# EasyEDA Pro project esp32-s3-handheld-jlcpcb-project.epro, board PCB1_1
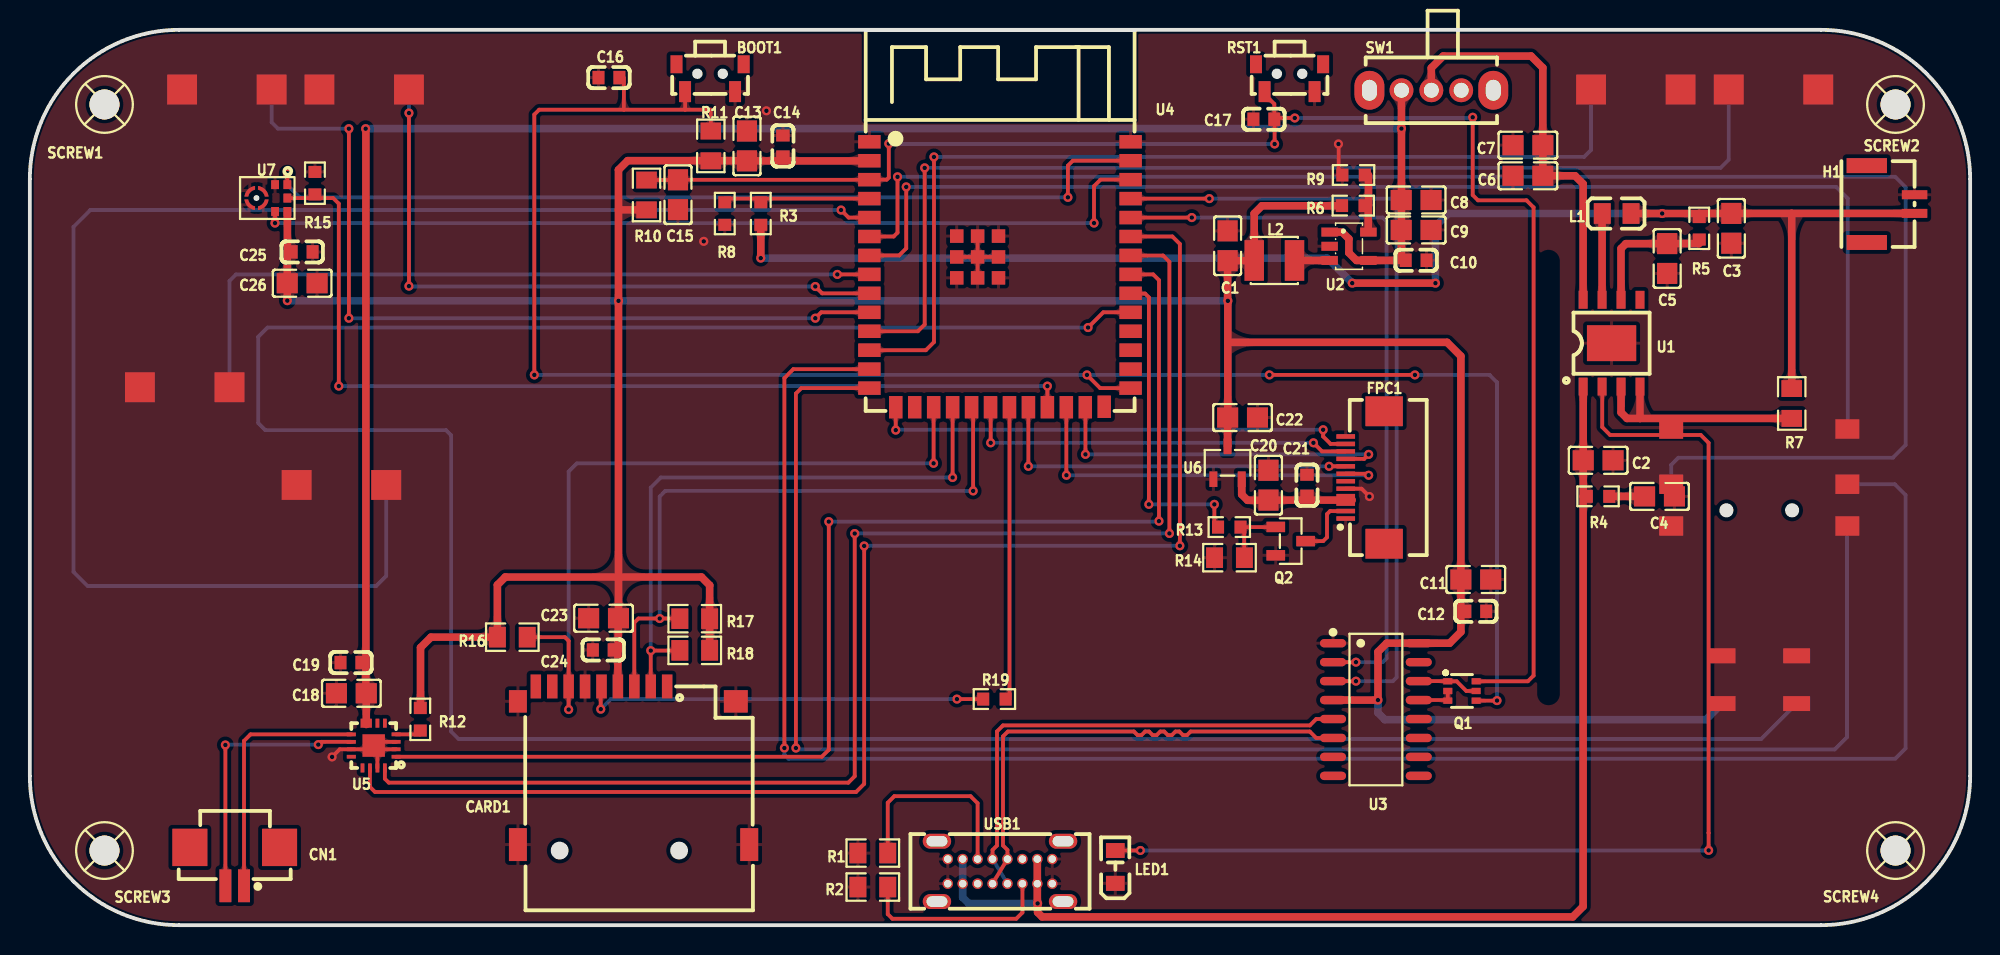
[diagram p1: board, top side]
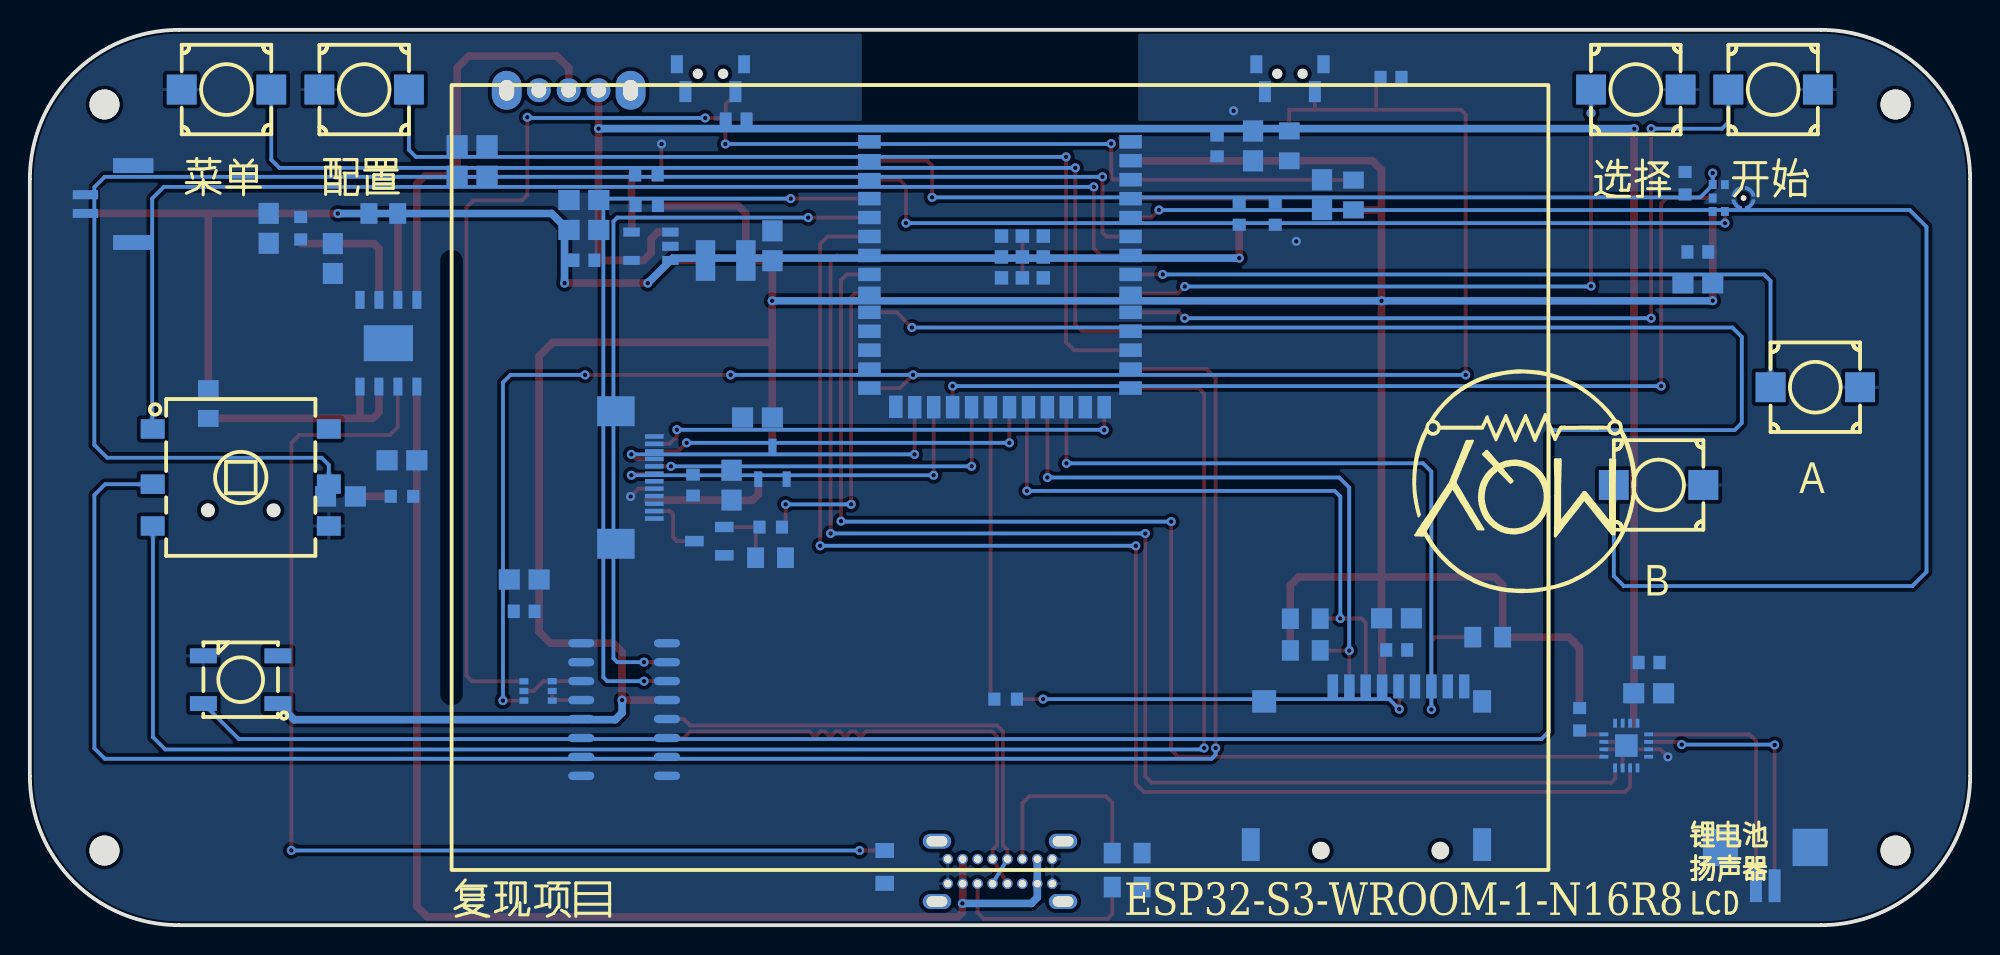
[diagram p2: board, bottom side, seen from below]

Outline 130 x 60 mm; copper layers: Top Layer, Bottom Layer. Coordinates in mm from the lower left corner of the outline.
Outline path: 0,50 0,10 arc(2.93,2.93) 10,0 120,0 arc(127.07,2.93) 130,10 130,50 arc(127.07,57.07) 120,60 10,60 arc(2.93,57.07) 0,50
Stack: Top Layer 0.035mm / Dielectric1 1.51mm FR4 er 4.5 / Bottom Layer 0.035mm

## Design rules (mm)
net D+: DP1
net D-: DP1
spacing copperThickness1oz (default): track to track 0.102, other pairs 0 to 0.3
spacing copperThickness2oz: track to track 0.203, other pairs 0.152 to 0.3
track width copperThickness1oz (default): min 0.127, default 0.254, max 2.54
track width copperThickness2oz: min 0.203, default 0.254, max 2.54
track width power: min 0.254, default 0.508, max 2.54
differential pair differentialPair (default): width min 0.127, default 0.254, max 2.54; gap min 0.152, default 0.152
net GND uses copperRegion

## Placement (name value [footprint] x y rotation side)
BOOT1  TS24CA 250gf 013  [SW-SMD_L4.7-W3.5-P3.35-EH]  45.58 56.77 0 top
C1  22uF  [C0805]  80.25 45.53 270 top
C2  10uF  [C0805]  105.07 31.15 180 top
C3  22uF  [C0805]  114 46.7 90 top
C4  10uF  [C0805]  109.19 28.73 180 top
C5  22uF  [C0805]  109.7 44.67 90 top
C6  22uF  [C0805]  100.37 50.22 0 top
C7  22uF  [C0805]  100.37 52.27 0 top
C8  22uF  [C0805]  92.88 48.6 180 top
C9  22uF  [C0805]  92.88 46.59 180 top
C10  100nF  [C0603]  92.88 44.56 180 top
C11  10uF  [C0805]  96.88 23.16 180 top
C12  100nF  [C0603]  96.88 21.03 180 top
C13  10uF  [C0805]  48.05 52.22 270 top
C14  100nF  [C0603]  50.46 52.22 270 top
C15  1uF  [C0805]  43.43 48.95 90 top
C16  100nF  [C0603]  38.8 56.8 180 top
C17  100nF  [C0603]  82.68 54.01 180 top
C18  10uF  [C0805]  21.54 15.54 180 top
C19  100nF  [C0603]  21.51 17.6 180 top
C20  10uF  [C0805]  82.98 29.49 270 top
C21  100nF  [C0603]  85.57 29.49 90 top
C22  10uF  [C0805]  81.25 34.02 0 top
C23  10uF  [C0805]  38.44 20.57 180 top
C24  100nF  [C0603]  38.42 18.44 180 top
C25  100nF  [C0603]  18.25 45.12 0 top
C26  10uF  [C0805]  18.25 43.02 180 top
CARD1  TF PUSH  [TF-SMD_TF-PUSH]  40.45 10.7 0 top
CN1  HC-1.25-2PWT  [CONN-SMD_2P-P1.25-HC-1.25-2PWT]  13.72 3.92 180 top
FPC1  FPC-05F-12PH20  [FPC-SMD_12P-P0.50_FPC-05F-12PH20]  89.45 30 90 top
H1  A1257WR-S-2P  [CONN-SMD_A1257WR-S-2P]  124.68 48.32 270 top
KEY1  HX TS665WS 200gf  [KEY-SMD_L6.0-W6.0-LS6.6]  116.82 56 0 bottom
KEY2  HX TS665WS 200gf  [KEY-SMD_L6.0-W6.0-LS6.6]  107.6 56 0 bottom
KEY3  HX TS665WS 200gf  [KEY-SMD_L6.0-W6.0-LS6.6]  22.4 56 180 bottom
KEY4  HX TS665WS 200gf  [KEY-SMD_L6.0-W6.0-LS6.6]  13.2 56 180 bottom
KEY5  HX TS665WS 200gf  [KEY-SMD_L6.0-W6.0-LS6.6]  10.38 36.05 180 bottom
KEY6  HX TS665WS 200gf  [KEY-SMD_L6.0-W6.0-LS6.6]  20.88 29.5 180 bottom
L1  1uH  [L0805]  106.32 47.69 0 top
L2  2.2uH  [IND-SMD_L3.0-W3.0_FNR30XXS]  83.38 44.55 0 top
LED1  XL-2012UOC  [LED0805-RD_ORANGE]  72.72 3.9 90 top
LED2  XL-5050RGBC-2812B-S  [LED-SMD_4P-L5.0-W5.0-TL-1]  115.88 16.45 0 bottom
Q1  UMH3N  [SC-70-6_L2.2-W1.3-P0.65-LS2.1-BR]  95.95 15.69 180 top
Q2  SS8050  [SOT-23-3_L2.9-W1.3-P1.90-LS2.4-BR]  84.48 25.74 180 top
R1  5.1kΩ  [R0805]  56.48 4.83 180 top
R2  5.1kΩ  [R0805]  56.48 2.55 0 top
R3  100kΩ  [R0603]  48.97 47.69 270 top
R4  2Ω  [R0603]  105.07 28.74 180 top
R5  500mΩ  [R0603]  111.85 46.7 90 top
R6  680kΩ  [R0603]  88.67 48.22 180 top
R7  1kΩ  [R0805]  118.05 34.96 90 top
R8  100kΩ  [R0603]  46.56 47.69 90 top
R9  150kΩ  [R0603]  88.69 50.27 0 top
R10  10kΩ  [R0805]  41.32 48.93 270 top
R11  10kΩ  [R0805]  45.62 52.22 90 top
R12  100kΩ  [R0603]  26.16 13.79 90 top
R13  2.2kΩ  [R0603]  80.36 26.68 0 top
R14  10kΩ  [R0805]  80.38 24.63 0 top
R15  100kΩ  [R0603]  19.1 49.72 90 top
R16  10kΩ  [R0805]  32.33 19.3 180 top
R17  10kΩ  [R0805]  44.55 20.54 0 top
R18  10kΩ  [R0805]  44.55 18.41 0 top
R19  22Ω  [R0603]  64.62 15.15 180 top
RST1  TS24CA 250gf 013  [SW-SMD_L4.7-W3.5-P3.35-EH]  84.4 56.77 0 top
SCREW1  -  [M2螺丝]  5 55 0 top
SCREW2  -  [M2螺丝]  125 55 0 top
SCREW3  -  [M2螺丝]  5 5 0 top
SCREW4  -  [M2螺丝]  125 5 0 top
SW1  SK12D07VG3  [SW-TH_SK12D07VG3]  93.9 55.95 180 top
SW2  10*10*9-6P WX  [SW-SMD-6P-L10.5-W10.0_C2858290]  115.87 30 180 bottom
U1  IP5306  [ESOP-8_L4.9-W3.9-P1.27-LS6.0-BL-EP]  105.97 39 0 top
U2  TLV62568DBVR  [SOT-23-5_L3.0-W1.7-P0.95-LS2.8-BR]  88.38 45.5 180 top
U3  CH340C  [SOP-16_L10.0-W3.9-P1.27-LS6.0-BL]  90.19 14.45 270 top
U4  ESP32-S3-WROOM-1-N16R8  [WIRELM-SMD_ESP32-S3-WROOM-1]  65 43.6 0 top
U5  MAX98357AETE+T  [TQFN-16_L3.0-W3.0-P0.50-BL-EP1.5]  23.04 12.03 90 top
U6  ME6210A33M3G  [SOT-23-3_L3.0-W1.7-P0.95-LS2.9-BR]  80.25 30.99 270 top
U7  ICS-43434  [MIC-SMD_6P-L3.5-W2.7-P0.90-BL]  15.97 48.73 180 top
USB1  HX-TYPE-C 16P 180 LC-B H13.0  [USB-C-TH_TYPE-C16PLCH10.0-B143]  65 3.6 0 top

## Footprints (pads in the part's own frame, mm; a bottom-side part is the same pattern mirrored in y, then rotated)
C0603
  rect 0.8x0.9 hole 0.001: 1(-0.7,0) 2(0.7,0)
C0805
  rect 1.41x1.35 hole 0.001: 1(-1,0) 2(1,0)
CONN-SMD_2P-P1.25-HC-1.25-2PWT
  rect 0.8x2.2 hole 0.001: 1(-0.625,1.285) 2(0.625,1.285)
  rect 2.35x2.5 hole 0.001: 3(-3.005,-1.285) 4(3.005,-1.285)
CONN-SMD_A1257WR-S-2P
  rect 0.6x1.7 hole 0.001: 1(0.625,1.6) 2(-0.625,1.6)
  rect 1x2.7 hole 0.001: 3(2.575,-1.6) 4(-2.575,-1.6)
ESOP-8_L4.9-W3.9-P1.27-LS6.0-BL-EP
  rect 0.6x1.2 hole 0.001: 1(-1.905,-2.909) 2(-0.635,-2.909) 3(0.635,-2.909) 4(1.905,-2.909) 5(1.905,2.909) 6(0.635,2.909) 7(-0.635,2.909) 8(-1.905,2.909)
  rect 3.3x2.4 hole 0.001: 9(0,0)
FPC-SMD_12P-P0.50_FPC-05F-12PH20
  rect 0.3x1.25 hole 0.001: 1(-2.75,1.288) 2(-2.25,1.288) 3(-1.75,1.288) 4(-1.25,1.288) 5(-0.75,1.288) 6(-0.25,1.288) 7(0.25,1.288) 8(0.75,1.288) 9(1.25,1.288) 10(1.75,1.288) 11(2.25,1.288) 12(2.75,1.288)
  rect 2x2.5 hole 0.001: 13(4.44,-1.288) 14(-4.44,-1.288)
IND-SMD_L3.0-W3.0_FNR30XXS
  rect 1.3x2.72 hole 0.001: 1(1.35,0) 2(-1.35,0)
KEY-SMD_L6.0-W6.0-LS6.6
  rect 2x2 hole 0.001: 1(-3,0) 2(3,0)
L0805
  rect 1.133x1.377 hole 0.001: 1(-0.966,0) 2(0.966,0)
LED0805-RD_ORANGE
  rect 1x1.25 hole 0.001: 1(-1.1,0) 2(1.1,0)
LED-SMD_4P-L5.0-W5.0-TL-1
  rect 1.8x1 hole 0.001: 1(-2.5,1.6) 2(-2.5,-1.6) 3(2.5,-1.6) 4(2.5,1.6)
M2螺丝
  round 2 hole 2: 1(0,0)
MIC-SMD_6P-L3.5-W2.7-P0.90-BL
  rect 0.52x0.6 hole 0.001: 1(-1.286,-0.9) 2(-0.465,-0.9) 4(-0.465,0.9) 5(-1.286,0.9) 6(-1.286,0)
  custom 0.709x0.71 hole 0.001: 3(0.276,-0.452) 3(0.329,0.505) 3(1.234,-0.505) 3(1.286,0.452)
R0603
  rect 0.806x0.864 hole 0.001: 1(-0.753,0) 2(0.753,0)
R0805
  rect 1.133x1.377 hole 0.001: 1(-1,0) 2(1,0)
SC-70-6_L2.2-W1.3-P0.65-LS2.1-BR
  rect 0.6x0.42 hole 0.001: 1(0.95,-0.65) 2(0.95,0) 3(0.95,0.65) 4(-0.95,0.65) 5(-0.95,0) 6(-0.95,-0.65)
SOP-16_L10.0-W3.9-P1.27-LS6.0-BL
  oval 0.56x1.745 hole 0.001: 1(-4.445,-2.873) 2(-3.175,-2.873) 3(-1.905,-2.873) 4(-0.635,-2.873) 5(0.635,-2.873) 6(1.905,-2.873) 7(3.175,-2.873) 8(4.445,-2.873) 9(4.445,2.873) 10(3.175,2.873) 11(1.905,2.873) 12(0.635,2.873) 13(-0.635,2.873) 14(-1.905,2.873) 15(-3.175,2.873) 16(-4.445,2.873)
SOT-23-3_L2.9-W1.3-P1.90-LS2.4-BR
  rect 1.25x0.7 hole 0.001: 1(1,-0.95) 2(1,0.95) 3(-1,0)
SOT-23-3_L3.0-W1.7-P0.95-LS2.9-BR
  rect 1.038x0.532 hole 0.001: 1(1.101,-0.95) 2(1.101,0.95) 3(-1.101,0)
SOT-23-5_L3.0-W1.7-P0.95-LS2.8-BR
  rect 1.1x0.6 hole 0.001: 1(1.3,-0.95) 2(1.3,0) 3(1.3,0.95) 4(-1.3,0.95) 5(-1.3,-0.95)
SW-SMD-6P-L10.5-W10.0_C2858290
  rect 1.6x1.3 hole 0.001: 1(-5.9,3.25) 2(-5.9,-0.45) 3(-5.9,-3.25) 4(5.9,-3.25) 5(5.9,-0.45) 6(5.9,3.25)
SW-SMD_L4.7-W3.5-P3.35-EH
  rect 0.8x1.4 hole 0.001: 1(-1.675,-0.917) 2(1.675,-0.917)
  rect 0.8x1.2 hole 0.001: 3(-2.25,0.917) 4(2.25,0.917)
SW-TH_SK12D07VG3
  oval 1.6x1.6 hole 1: 1(-2,0) 2(0,0) 3(2,0)
  oval 2x2.6 hole 1x1.4: 4(4.15,0) 5(-4.15,0)
TF-SMD_TF-PUSH
  rect 0.7x1.6 hole 0.001: 1(2.25,5.3) 2(1.15,5.3) 3(0.05,5.3) 4(-1.05,5.3) 5(-2.15,5.3) 6(-3.25,5.3) 7(-4.35,5.3) 8(-5.45,5.3) CD(-6.55,5.3)
  rect 1.2x1.5 hole 0.001: 10(-7.75,4.3)
  rect 1.2x2.2 hole 0.001: 11(-7.75,-5.3) 12(7.75,-5.3)
  rect 1.6x1.5 hole 0.001: 13(6.85,4.3)
TQFN-16_L3.0-W3.0-P0.50-BL-EP1.5
  rect 0.25x0.6 hole 0.001: 1(-0.749,-1.5) 2(-0.248,-1.5) 3(0.252,-1.5) 4(0.751,-1.5) 9(0.75,1.5) 10(0.25,1.5) 11(-0.25,1.5) 12(-0.749,1.5)
  rect 0.6x0.25 hole 0.001: 5(1.5,-0.748) 6(1.5,-0.248) 7(1.5,0.252) 8(1.5,0.752) 13(-1.5,0.752) 14(-1.5,0.252) 15(-1.5,-0.248) 16(-1.5,-0.748)
  rect 1.5x1.5 hole 0.001: 17(0,0)
USB-C-TH_TYPE-C16PLCH10.0-B143
  oval 1.9x1 hole 1.4x0.7: 0(-4.225,2.02) 0(-4.225,-2.02) 0(4.225,2.02) 0(4.225,-2.02)
  round 0.7 hole 0.5: A1(-3.5,0.825) A4(-2.5,0.825) A5(-1.5,0.825) A6(-0.5,0.825) A7(0.5,0.825) A8(1.5,0.825) A9(2.5,0.825) A12(3.5,0.825) B1(3.5,-0.825) B4(2.5,-0.825) B5(1.5,-0.825) B6(0.5,-0.825) B7(-0.5,-0.825) B8(-1.5,-0.825) B9(-2.5,-0.825) B12(-3.5,-0.825)
WIRELM-SMD_ESP32-S3-WROOM-1
  rect 1.5x0.9 hole 0.001: 1(-8.75,8.895) 2(-8.75,7.625) 3(-8.75,6.355) 4(-8.75,5.085) 5(-8.75,3.815) 6(-8.75,2.545) 7(-8.75,1.275) 8(-8.75,0.005) 9(-8.75,-1.265) 10(-8.75,-2.535) 11(-8.75,-3.805) 12(-8.75,-5.075) 13(-8.75,-6.345) 14(-8.75,-7.615) 27(8.75,-7.615) 28(8.75,-6.345) 29(8.75,-5.075) 30(8.75,-3.805) 31(8.75,-2.535) 32(8.75,-1.265) 33(8.75,0.005) 34(8.75,1.275) 35(8.75,2.545) 36(8.75,3.815) 37(8.75,5.085) 38(8.75,6.355) 39(8.75,7.625) 40(8.75,8.895)
  rect 0.9x1.5 hole 0.001: 15(-6.985,-8.895) 16(-5.715,-8.895) 17(-4.445,-8.895) 18(-3.175,-8.895) 19(-1.905,-8.895) 20(-0.635,-8.895) 21(0.635,-8.895) 22(1.905,-8.895) 23(3.175,-8.895) 24(4.445,-8.895) 25(5.715,-8.895) 26(6.985,-8.865)
  rect 0.9x0.9 hole 0.001: 41(-2.9,2.575) 41(-2.9,1.175) 41(-2.9,-0.225) 41(-1.5,2.575) 41(-1.5,1.175) 41(-1.5,-0.225) 41(-0.1,2.575) 41(-0.1,1.175) 41(-0.1,-0.225)

## Nets
As in the schematic.

Pads without a net: BOOT1 3 4; CARD1 1 8 CD; CN1 3 4; FPC1 6 13 14; H1 3 4; LED2 2; RST1 3 4; SCREW1 1; SCREW2 1; SCREW3 1; SCREW4 1; SW1 1 4 5; SW2 6; U1 5; U3 7 8 9 10 11 12 15; U4 16 26 28 29 30; U5 5 6 12 13; USB1 0 A8 B8

## Via types
v1: diameter 0.61, hole 0.305, Top Layer to Bottom Layer, 80 vias

## Routing (per net, layer and track width the routed paths; a pad name or vN(x,y) marks a point on that pad's centre or on a via; arc(x,y) is an arc through that point)
3V3LCD: length 8.6
  Top Layer w0.508: 81.2,29.88 81.2,28.86 81.59,28.47 82.97,28.47 C20.2 88.59,28.49
3V3M: length 249
  Top Layer w0.508: U3.4 v1(90.32,15.08) 90.32,18.31 90.91,18.9 93.05,18.9 U3.16 95.12,18.89 95.88,19.65 C11.2 95.88,38.13 94.95,39.06 80.26,39.06 ; 80.26,39.06 80.26,34.03 C22.1 80.25,32.09 U6.3 ; 80.26,39.06 v1(80.26,41.84) 80.25,41.85 C1.2 82.01,44.53 L2.2 82.03,47.69 82.55,48.21 87.66,48.21 87.67,48.22 ; 39.44,23.33 39.44,47.94 ; 39.44,23.33 31.86,23.33 31.33,22.8 R16.2 26.88,19.3 26.17,18.6 26.17,14.81 26.16,14.79 ; 39.44,23.33 45,23.33 45.55,22.78 R17.2 R18.2 ; 39.44,23.33 C23.1 39.42,20.55 39.42,18.44 39.4,18.42 CARD1.4 ; 39.44,47.94 39.44,50.61 40.06,51.23 45.61,51.23 R11.1 48.04,51.22 C13.2 56.24,51.22 U4.2 ; 39.44,47.93 R10.2 ; v1(17.25,41.85) 17.25,43.01 C26.2 17.25,45.12 17.25,45.13 U7.5
  Bottom Layer w0.508: v1(90.32,15.08) 90.32,14.23 90.78,13.77 112.3,13.77 LED2.1 ; v1(80.26,41.84) v1(39.44,41.84) 17.26,41.84 v1(17.25,41.85)
+5V: length 126.7
  Top Layer w0.508: 22.54,13.45 C18.1 22.51,15.56 22.51,53.36 v1(22.5,53.38) ; U2.1 87.92,46.45 88.38,45.99 88.38,45.06 88.88,44.55 U2.4 91.87,44.55 91.9,44.57 v1(91.9,53.38) 91.9,55.8
  Bottom Layer w0.508: v1(22.5,53.38) 22.51,53.38 v1(91.9,53.38)
GND: length 17
  Top Layer w0.254: U5.15 23.29,11.79 ; 23.29,11.79 U5.17 ; 23.29,11.79 U5.2 ; 87.69,50.27 87.69,52.34 v1(87.68,52.35) ; U5.17 22.79,11.78 U5.11 20.76,11.78 v1(20.25,11.28) ; U5.17 23.29,12.29 U5.3 ; U4.41 63.5,44.78 ; 63.5,44.78 U4.41 ; 63.5,44.78 64.9,44.78 ; 63.5,44.78 62.1,44.78 ; v1(89.75,28.72) 89.22,29.25 FPC1.5
  vias: v1(45.15,45.82) v1(49.35,54.57)
VBUS: length 83.1
  Top Layer w0.508: 67.5,4.43 67.5,1.46 ; v1(67.52,1.46) 67.52,0.86 67.82,0.55 103.37,0.55 104.07,1.25 104.07,28.74 104.07,28.74 C2.2 104.07,36.09 U1.1
  Bottom Layer w0.508: 62.5,4.43 62.5,1.85 62.9,1.46 v1(67.52,1.46)
BAT+: length 98.5
  Top Layer w0.508: L1.2 v1(109.37,47.69) 111.84,47.69 111.85,47.7 ; 114,47.7 126.84,47.7 ; R7.2 118.05,47.7 ; C3.2 111.85,47.7 ; v1(88.6,43.02) v1(94.18,43.02) ; 48.97,46.69 48.97,44.71 v1(48.97,44.7)
  Bottom Layer w0.508: v1(94.18,43.02) 94.18,46.82 95.04,47.69 v1(109.37,47.69) ; v1(88.6,43.02) 86.92,44.7 v1(48.97,44.7)
CHIP_PU: length 106.4
  Top Layer w0.254: v1(84.75,54.09) 83.47,54.09 C17.1 ; v1(83.4,52.35) 83.4,53.99 C17.1 ; C17.1 83.38,55.03 82.72,55.68 ; Q1.6 100.37,16.34 100.75,16.72 100.75,48.1 100.28,48.57 97.03,48.57 96.67,48.93 v1(96.67,54.14) ; v1(57.55,52.38) 57.55,50.1 57.41,49.96 U4.3 56.24,49.95 C15.2 43.41,49.93 R10.1
  Bottom Layer w0.254: v1(57.55,52.38) 57.57,52.35 v1(83.4,52.35) ; v1(96.67,54.14) 96.62,54.09 v1(84.75,54.09)
D+: length 33.5
  Top Layer w0.254: U3.5 86.19,13.81 85.75,13.38 65.2,13.38 64.8,12.98 64.8,5.33 64.5,5.04 64.5,4.43
  Bottom Layer w0.254: 65.5,2.78 64.5,4.43
D-: length 33.5
  Top Layer w0.254: 64.5,2.78 65.5,4.43 65.5,5.04 65.2,5.33 65.2,12.65 65.53,12.98 73.97,12.98 74.21,12.73 74.48,12.73 74.72,12.98 74.99,12.98 75.23,12.73 75.5,12.73 75.74,12.98 76,12.98 76.25,12.73 76.51,12.73 76.75,12.98 77.02,12.98 77.26,12.73 77.53,12.73 77.77,12.98 85.75,12.98 86.19,12.54 U3.6
DTR: length 2.6
  Top Layer w0.254: U3.13 94.96,15.08 95,15.04 Q1.2
GPIO0: length 124.9
  Top Layer w0.254: R11.2 45.62,54.65 ; 39.8,56.8 39.8,54.65 ; v1(70.82,36.88) 71.71,35.99 U4.27 ; 96.9,15.04 98.29,15.04 v1(98.3,15.05) ; 43.9,54.65 34.12,54.65 33.8,54.32 v1(33.8,36.88) ; 43.9,54.65 BOOT1.1 ; 43.9,54.65 45.63,54.65 ; v1(92.8,36.88) v1(83.05,36.88)
  Bottom Layer w0.254: v1(92.8,36.88) 97.8,36.88 98.3,36.38 v1(98.3,15.05) ; v1(33.8,36.88) v1(70.82,36.88) v1(83.05,36.88)
GPIO1: length 60.7
  Top Layer w0.254: U4.39 69.88,51.23 69.55,50.9 v1(69.55,48.77) ; U7.1 17.25,49.63 v1(17.25,50.4)
  Bottom Layer w0.254: v1(17.25,50.4) 17.25,49.6 18.08,48.77 v1(69.55,48.77)
GPIO2: length 60.8
  Top Layer w0.254: v1(71.3,47.05) 71.3,49.52 71.74,49.96 U4.38 ; U7.4 16.42,47.82 v1(16.42,47.05)
  Bottom Layer w0.254: v1(71.3,47.05) v1(16.42,47.05)
GPIO3: length 32.3
  Top Layer w0.254: v1(86.65,33.2) 86.65,32.75 87.15,32.25 FPC1.11 ; U4.15 v1(58.01,33.17)
  Bottom Layer w0.254: v1(58.01,33.17) 58.04,33.2 v1(86.65,33.2)
GPIO4: length 9.7
  Top Layer w0.254: 46.56,48.69 56.25,48.69
GPIO5: length 104.8
  Top Layer w0.254: U4.5 54.85,47.42 v1(54.35,47.92)
  Bottom Layer w0.254: KEY6.1 23.88,23.4 23.2,22.72 3.88,22.72 2.92,23.67 2.92,46.8 4.05,47.92 v1(54.35,47.92)
GPIO6: length 108.4
  Top Layer w0.254: U4.6 57.88,46.15 58.13,46.41 v1(58.13,50.15)
  Bottom Layer w0.254: 110,29.57 SW2.5 109.97,30.84 110.45,31.32 124.82,31.32 125.68,32.18 125.68,49.45 124.98,50.15 v1(58.13,50.15)
GPIO7: length 85.6
  Top Layer w0.254: v1(58.72,49.47) 58.72,45.36 58.24,44.88 U4.7
  Bottom Layer w0.254: SW2.1 121.8,33.28 121.8,48.7 121.02,49.47 v1(58.72,49.47)
GPIO8: length 65.2
  Top Layer w0.254: U4.12 60.03,38.53 60.57,39.07 v1(60.57,51.48)
  Bottom Layer w0.254: KEY2.1 104.6,51.95 104.13,51.48 v1(60.57,51.48)
GPIO9: length 51.9
  Top Layer w0.254: v1(60.55,30.95) 60.55,34.7 U4.17 ; R16.1 35.85,19.3 36.1,19.05 36.1,16 ; CARD1.7 v1(36.1,14.45)
  Bottom Layer w0.254: v1(60.55,30.95) 36.65,30.95 36.1,30.4 v1(36.1,14.45)
GPIO10: length 40.5
  Top Layer w0.254: 41.6,16 v1(41.6,18.4) 43.53,18.4 R18.1 ; U4.18 v1(61.82,30)
  Bottom Layer w0.254: v1(41.6,18.4) 41.6,29.32 42.28,30 v1(61.82,30)
GPIO11: length 42.4
  Top Layer w0.254: CARD1.3 40.5,20.27 40.78,20.55 v1(42.2,20.55) 43.54,20.55 R17.1 ; v1(63.2,29.1) 63.2,34.6 U4.19
  Bottom Layer w0.254: v1(63.2,29.1) 42.57,29.1 42.2,28.72 v1(42.2,20.55)
GPIO12: length 26.4
  Top Layer w0.254: v1(86,32.32) 86.57,31.75 FPC1.10 ; v1(64.38,32.32) 64.38,34.7 U4.20
  Bottom Layer w0.254: v1(86,32.32) v1(64.38,32.32)
GPIO13: length 19.6
  Top Layer w0.254: U4.21 65.63,15.16 65.62,15.15
GPIO14: length 25.2
  Top Layer w0.254: v1(66.9,30.75) 66.9,34.7 U4.22 ; FPC1.8 v1(87.05,30.75)
  Bottom Layer w0.254: v1(87.05,30.75) v1(66.9,30.75)
GPIO15: length 50.2
  Top Layer w0.254: U4.8 v1(54.1,43.61)
  Bottom Layer w0.254: v1(54.1,43.61) 13.81,43.61 13.38,43.17 KEY5.1
GPIO16: length 44.2
  Top Layer w0.254: v1(52.62,42.8) 53.09,42.34 U4.9 ; v1(25.4,42.82) v1(25.4,54.42)
  Bottom Layer w0.254: v1(52.62,42.8) 25.42,42.8 v1(25.4,42.82) ; v1(25.4,54.42) KEY3.1
GPIO17: length 55.3
  Top Layer w0.254: v1(21.38,40.67) v1(21.38,53.38) ; U4.10 53.02,41.07 v1(52.62,40.67)
  Bottom Layer w0.254: KEY4.1 16.2,53.8 16.62,53.38 v1(21.38,53.38) ; v1(52.62,40.67) v1(21.38,40.67)
GPIO18: length 73.2
  Top Layer w0.254: 56.25,39.8 59.5,39.8 59.95,40.25 v1(59.95,50.75)
  Bottom Layer w0.254: v1(59.95,50.75) 113.28,50.75 113.82,51.3 113.82,55.97 113.8,56
GPIO19: length 127.9
  Top Layer w0.254: U4.13 51.15,37.26 50.55,36.66 v1(50.55,11.87)
  Bottom Layer w0.254: v1(50.55,11.87) 50.55,11.42 50.83,11.15 124.97,11.15 125.68,11.85 125.68,28.82 124.95,29.55 SW2.2
GPIO20: length 113.8
  Top Layer w0.254: U4.14 51.69,35.99 51.32,35.62 v1(51.32,11.87)
  Bottom Layer w0.254: SW2.3 121.75,26.73 121.75,12.6 120.93,11.77 51.53,11.77 51.43,11.87 v1(51.32,11.87)
GPIO21: length 64.7
  Top Layer w0.254: v1(20.7,36.12) 20.7,48.35 20.33,48.72 17.26,48.72 U7.6 ; U4.23 v1(68.18,36.12)
  Bottom Layer w0.254: v1(68.18,36.12) v1(20.7,36.12)
GPIO38: length 189.4
  Top Layer w0.254: v1(70.9,40.05) 71.92,41.07 U4.31
  Bottom Layer w0.254: LED2.4 116,12.47 28.72,12.47 28.22,12.97 28.22,32.82 27.88,33.17 15.78,33.17 15.3,33.65 15.3,39.42 15.92,40.05 v1(70.9,40.05)
GPIO39: length 21.1
  Top Layer w0.254: U4.32 73.76,42.32 74.72,42.32 74.97,42.07 v1(74.97,28.2) ; 79.36,26.68 v1(79.36,28.2)
  Bottom Layer w0.254: v1(79.36,28.2) v1(74.97,28.2)
GPIO40: length 84.8
  Top Layer w0.254: U5.1 53.06,11.29 53.53,11.75 v1(53.53,27.04) ; U4.33 75.26,43.61 75.65,43.22 v1(75.65,27.07)
  Bottom Layer w0.254: v1(53.53,27.04) 75.62,27.04 v1(75.65,27.07)
GPIO41: length 90.8
  Top Layer w0.254: v1(55.27,26.25) 55.27,9.98 54.84,9.55 24.05,9.55 23.79,9.81 23.79,10.53 ; v1(76.35,26.25) 76.35,44.45 75.93,44.88 73.75,44.88 U4.34
  Bottom Layer w0.254: v1(76.35,26.25) 55.51,26.25 55.51,26.25 v1(55.27,26.25)
GPIO42: length 95.6
  Top Layer w0.254: U4.35 76.55,46.15 77.05,45.65 v1(77.05,25.42) ; v1(55.9,25.42) 55.9,9.47 55.36,8.92 23.12,8.92 22.79,9.26 22.79,10.53
  Bottom Layer w0.254: v1(77.05,25.42) 56.18,25.42 56.18,25.42 v1(55.9,25.42)
GPIO47: length 26.4
  Top Layer w0.254: v1(69.45,30.15) 69.44,30.16 U4.24 ; FPC1.7 89.6,30.25 v1(89.7,30.15)
  Bottom Layer w0.254: v1(89.7,30.15) v1(69.45,30.15)
GPIO48: length 23.8
  Top Layer w0.254: U4.25 70.72,34.7 v1(70.72,31.55) ; FPC1.9 89.4,31.25 v1(89.7,31.55)
  Bottom Layer w0.254: v1(89.7,31.55) v1(70.72,31.55)
RTS: length 4.1
  Top Layer w0.254: Q1.5 96.24,15.69 95.59,16.34 Q1.1 94.99,16.35 U3.14
U0RXD: length 50.2
  Top Layer w0.254: U4.36 v1(77.85,47.42) ; v1(88.85,17.62) U3.2
  Bottom Layer w0.254: v1(77.85,47.42) 90.65,47.42 90.9,47.17 90.9,17.88 90.65,17.62 v1(88.85,17.62)
U0TXD: length 54.1
  Top Layer w0.254: v1(88.85,16.35) 87.32,16.35 U3.3 ; U4.37 v1(79.03,48.69)
  Bottom Layer w0.254: v1(88.85,16.35) 91.32,16.35 91.57,16.6 91.57,48.35 91.24,48.69 v1(79.03,48.69)
VOUT: length 27.7
  Top Layer w0.508: U1.8 104.07,49.68 103.53,50.22 C6.2 C7.2 101.37,57.46 100.58,58.24 94.69,58.24 93.9,57.45 93.9,55.8
$3N34531: length 4.2
  Top Layer w0.254: R14.2 81.36,24.64 81.36,26.68 83.47,26.68 Q2.1
$3N34538: length 4.4
  Top Layer w0.254: FPC1.2 87.11,27.75 86.91,27.55 86.91,26 86.65,25.74 Q2.3
$3N34554: length 13.5
  Top Layer w0.254: R1.1 57.48,8.2 57.92,8.64 63.02,8.64 63.5,8.17 63.5,4.43
$3N34556: length 13.1
  Top Layer w0.254: R2.2 57.48,0.74 57.79,0.43 66.08,0.43 66.5,0.85 66.5,2.78 66.5,2.78
$3N34586: length 8.8
  Top Layer w0.508: 111.85,45.7 111.82,45.67 C5.2 109.69,45.67 106.93,45.67 106.61,45.34 106.61,41.91
$3N34588: length 5.8
  Top Layer w0.508: L1.1 105.34,47.68 U1.7
$3N34595: length 77.4
  Top Layer w0.254: LED1.2 v1(74.4,5) ; v1(112.48,5.01) 112.48,6.18 112.47,6.18 112.47,32.33 111.95,32.85 105.88,32.85 105.35,33.38 105.35,36.08 U1.2
  Bottom Layer w0.254: v1(74.4,5) 112.47,5 v1(112.48,5.01)
$3N34601: length 15.5
  Top Layer w0.508: 106.61,36.09 106.61,34.36 107.01,33.96 107.88,33.96 ; 107.88,33.96 118.04,33.96 ; 107.88,33.96 U1.4
$3N34619: length 2.1
  Top Layer w0.508: C4.2 108.18,28.74 106.07,28.74
$3N34652: length 2.4
  Top Layer w0.508: L2.1 87.08,44.55 U2.3
$3N34657: length 3.8
  Top Layer w0.508: U2.5 89.67,46.46 89.67,48.22 89.69,48.24 89.69,50.27
$3N34720: length 17.1
  Top Layer w0.254: CN1.1 14.35,12.35 14.78,12.78 U5.9
$3N34722: length 18
  Top Layer w0.254: CN1.2 v1(13.1,12.07) ; U5.10 19.51,12.29 v1(19.33,12.1)
  Bottom Layer w0.254: v1(13.1,12.07) 13.12,12.1 v1(19.33,12.1)
$3N34731: length 1.6
  Top Layer w0.254: 26.16,12.79 26.15,12.79 U5.4
$3N34770: length 27.2
  Top Layer w0.254: v1(38.25,14.47) 38.25,15.95 CARD1.5 ; 63.62,15.15 v1(62.11,15.15)
  Bottom Layer w0.254: v1(38.25,14.47) 38.92,15.15 v1(62.11,15.15)

## Copper pours and planes (outline as drawn; the poured copper is in the pictures)
GND on Top Layer: -1.5,60.82 130.97,60.82 130.97,-0.58 -1.5,-0.58
GND on Bottom Layer: -0.6,60.6 130.75,60.6 130.75,-0.8 -0.6,-0.8

Small or netless copper shapes (teardrops, artwork), in the pictures only: 304 on Top Layer, 91 on Bottom Layer

## Text on the board
Bottom Silkscreen Layer: A | 开始 | B | 选择 | 配置 | 菜单 | 锂电池 / 扬声器 / LCD | ESP32-S3-WROOM-1-N16R8 | 复现项目
